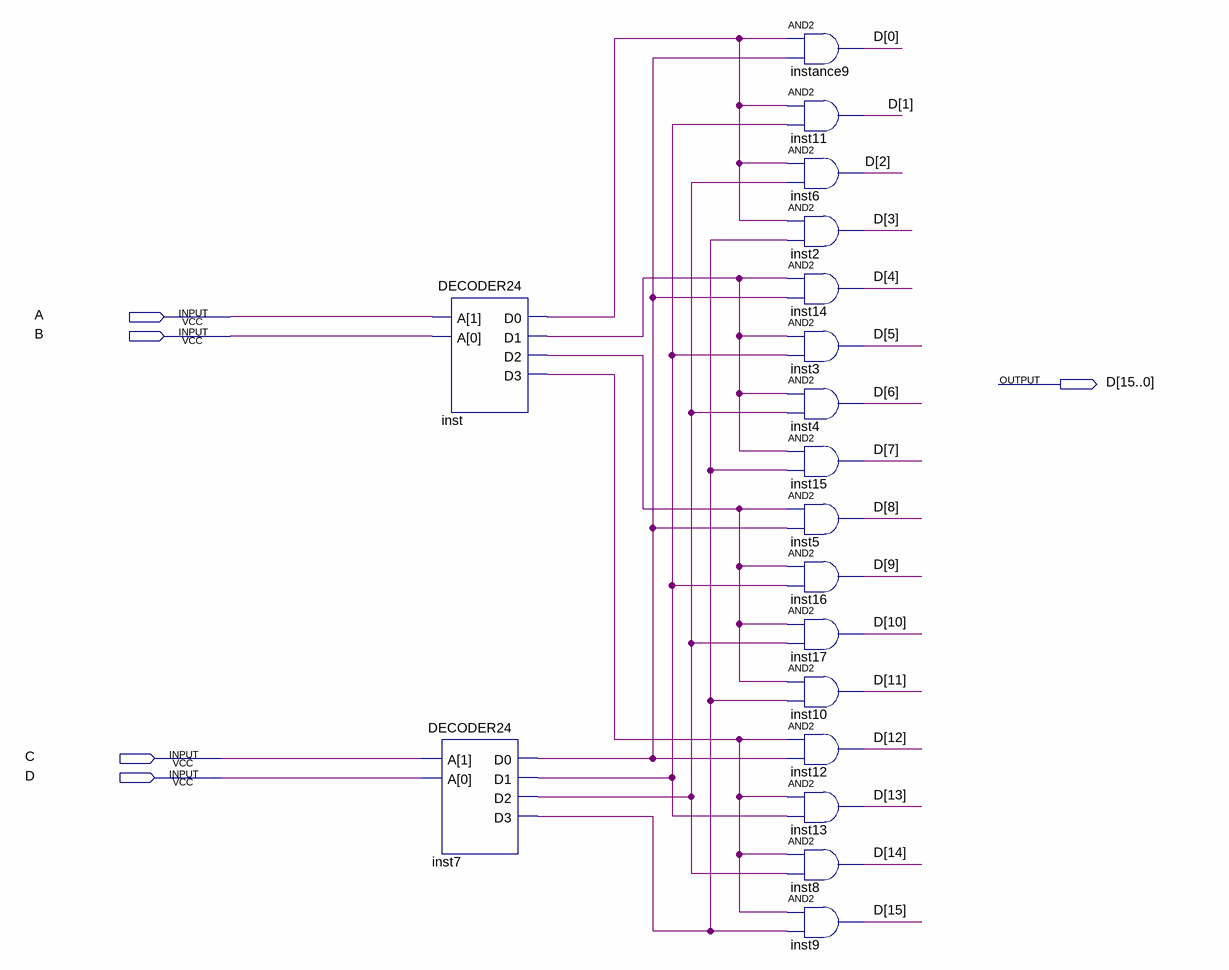
[diagram p0: schematic sheet]
// Quartus schematic DECODER416.bdf as structural Verilog: 18 symbols, 5 pins
module DECODER416 (
  input  A,
  input  B,
  input  C,
  input  D_1bit,
  output [15:0] D
);

  wire inst7_d0, inst7_d1, inst7_d2, inst7_d3, inst_d0, inst_d1, inst_d2, inst_d3;

  DECODER24 inst (.A({A, B}), .D0(inst_d0), .D1(inst_d1), .D2(inst_d2), .D3(inst_d3));
  DECODER24 inst7 (.A({C, D_1bit}), .D0(inst7_d0), .D1(inst7_d1), .D2(inst7_d2), .D3(inst7_d3));
  and instance9 (D[0], inst_d0, inst7_d0);
  and inst11 (D[1], inst_d0, inst7_d1);
  and inst6 (D[2], inst_d0, inst7_d2);
  and inst2 (D[3], inst_d0, inst7_d3);
  and inst14 (D[4], inst_d1, inst7_d0);
  and inst3 (D[5], inst_d1, inst7_d1);
  and inst4 (D[6], inst_d1, inst7_d2);
  and inst15 (D[7], inst_d1, inst7_d3);
  and inst5 (D[8], inst_d2, inst7_d0);
  and inst16 (D[9], inst_d2, inst7_d1);
  and inst17 (D[10], inst_d2, inst7_d2);
  and inst10 (D[11], inst_d2, inst7_d3);
  and inst12 (D[12], inst_d3, inst7_d0);
  and inst13 (D[13], inst_d3, inst7_d1);
  and inst8 (D[14], inst_d3, inst7_d2);
  and inst9 (D[15], inst_d3, inst7_d3);
endmodule
